# Altium schematic sheet 20_MicroSD_Connector.SchDoc
size A3; SheetNumber: 12; SheetTotal: 21
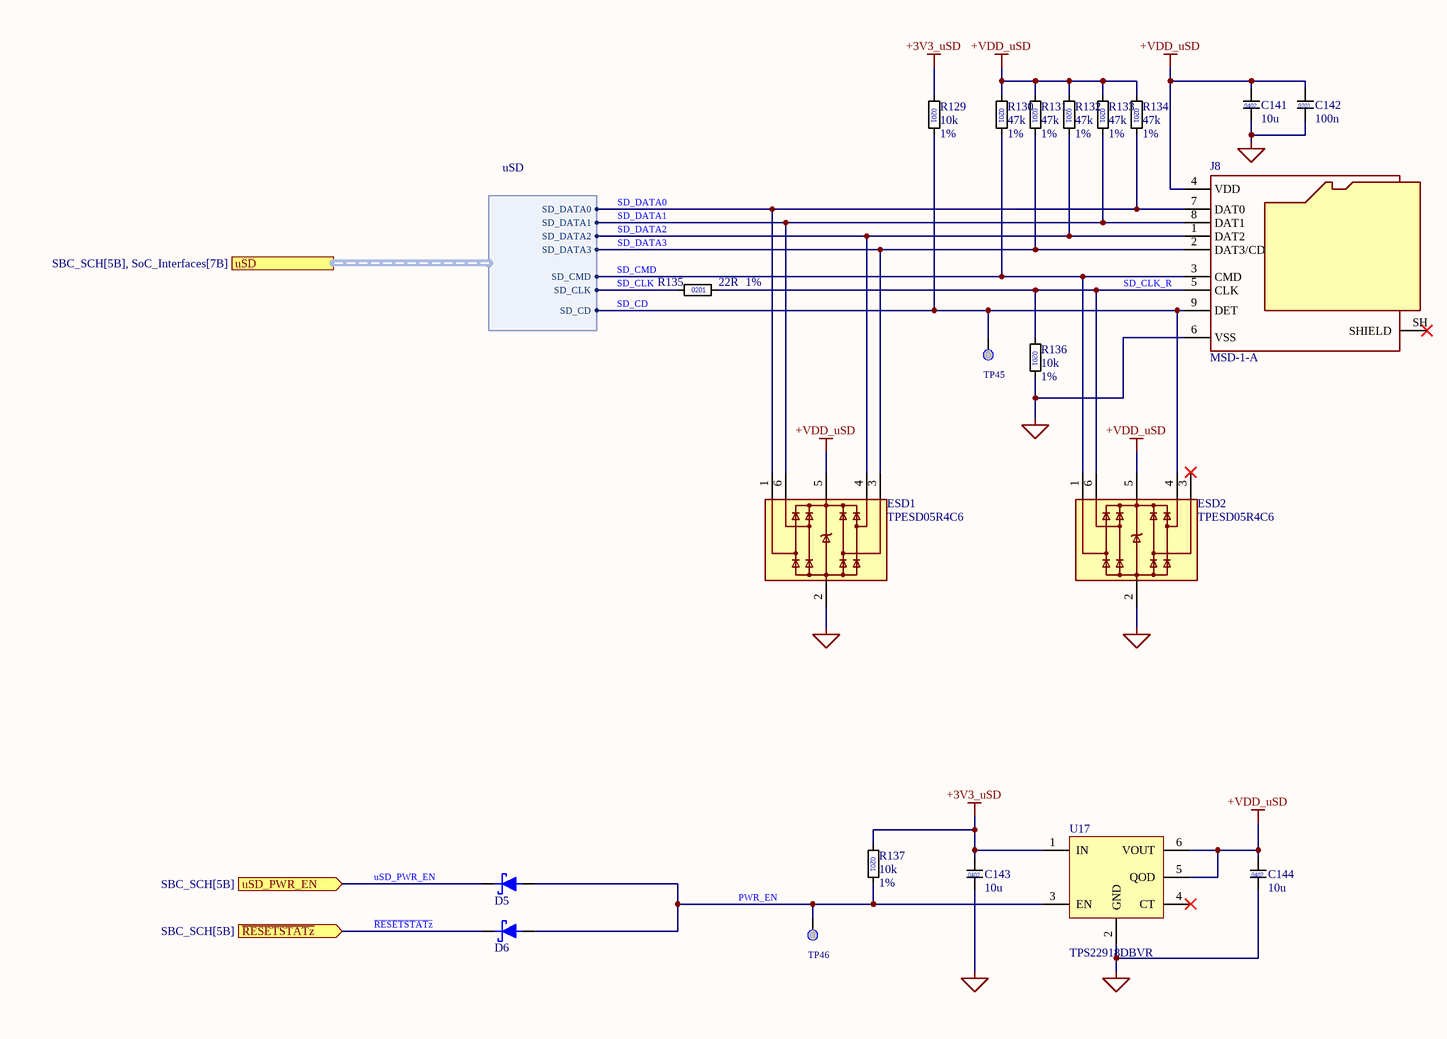
[diagram p0: 20_MicroSD_Connector.SchDoc]

## Parts
C141  value 10u  [C0402]  (hidden comment: 4u7)
C142  value 100n  [C0201]  (hidden comment: C_0201)
C143  value 10u  [C0402]  (hidden comment: 4u7)
C144  value 10u  [C0402]  (hidden comment: 4u7)
D5  D_Filled  [D_SOD-523]  (value not drawn)
D6  D_Filled  [D_SOD-523]  (value not drawn)
ESD1  TPESD05R4C6  [TPESD05R4C6]
ESD2  TPESD05R4C6  [TPESD05R4C6]
J8  MSD-1-A  [MSD-1-A]
R129  value 10k  Tolerance: 1%  [R0201]  (hidden comment: 0201)
R130  value 47k  Tolerance: 1%  [R0201]  (hidden comment: 0201)
R131  value 47k  Tolerance: 1%  [R0201]  (hidden comment: 0201)
R132  value 47k  Tolerance: 1%  [R0201]  (hidden comment: 0201)
R133  value 47k  Tolerance: 1%  [R0201]  (hidden comment: 0201)
R134  value 47k  Tolerance: 1%  [R0201]  (hidden comment: 0201)
R135  value 22R  Tolerance: 1%  [R0201]  (hidden comment: 0201)
R136  value 10k  Tolerance: 1%  [R0201]  (hidden comment: 0201)
R137  value 10k  Tolerance: 1%  [R0201]  (hidden comment: 0201)
TP45  Testpoint 0.5mm  [TP_0.50mm]  (value not drawn)  (no BOM)
TP46  Testpoint 0.5mm  [TP_0.50mm]  (value not drawn)  (no BOM)
U17  value TPS22918DBVR  [SOT-23-6]  (hidden comment: TPS22918)

## Ports
uSD (harness uSD, see SBC_SCH[5B], SoC_Interfaces[7B]), uSD_PWR_EN (in, see SBC_SCH[5B]), ~{RESETSTATz} (in, see SBC_SCH[5B])

## Harnesses
uSD: SD_DATA0, SD_DATA1, SD_DATA2, SD_DATA3, SD_CMD, SD_CLK, SD_CD

## Nets
+3V3_uSD: C143.1 R129.1 R137.1 U17.1(IN)
+VDD_uSD: C141.1 C142.1 C144.1 ESD1.5 ESD2.5 J8.4(VDD) R130.1 R131.1 R132.1 R133.1 R134.1 U17.5(QOD) U17.6(VOUT)
GND: C141.2 C142.2 C143.2 C144.2 ESD1.2 ESD2.2 J8.6(VSS) R136.2 U17.2(GND)
~{RESETSTATz}: D6.1(K) ; port ~{RESETSTATz}
PWR_EN: D5.2(A) D6.2(A) R137.2 TP46.TP U17.3(EN)
SD_CD: ESD2.4 J8.9(DET) R129.2 TP45.TP ; port uSD.SD_CD
SD_CLK: R135.1 ; port uSD.SD_CLK
SD_CLK_R: ESD2.6 J8.5(CLK) R135.2 R136.1
SD_CMD: ESD2.1 J8.3(CMD) R130.2 ; port uSD.SD_CMD
SD_DATA0: ESD1.1 J8.7(DAT0) R134.2 ; port uSD.SD_DATA0
SD_DATA1: ESD1.6 J8.8(DAT1) R133.2 ; port uSD.SD_DATA1
SD_DATA2: ESD1.4 J8.1(DAT2) R132.2 ; port uSD.SD_DATA2
SD_DATA3: ESD1.3 J8.2(DAT3/CD) R131.2 ; port uSD.SD_DATA3
uSD_PWR_EN: D5.1(K) ; port uSD_PWR_EN

Not connected (* = marked no-connect by the designer): ESD2 3*; J8 SH(SHIELD)*; U17 4(CT)*

## Notes on the sheet
- (in symbol C_0201) 0201
- (in symbol C_0402) 0402

## Library data of the parts
C141 C143 C144 = C_0402: MLCC 0402; Manufacturer_Name: *; Manufacturer_Part_Number: *
C142 = C_0201: MLCC 0201; Manufacturer_Name: *; Manufacturer_Part_Number: *
D5 D6 = D_Filled: Diode, filled shape; Manufacturer_Name: Panjit International Inc.; Value: BAT54TS_R1_00001; Manufacturer Part Number: BAT54TS_R1_00001
ESD1 ESD2 = TPESD05R4C6: ESD and Surge Protection (TVS/ESD) 1.3pF 5V 5uA 6.5A@8/20us 9V 9V Four channels SOT-363  ROHS; Manufacturer_Name: TECH PUBLIC; Manufacturer_Part_Number: TPESD05R4C6; Value: TPESD05R4C6
J8 = MSD-1-A: Micro SD Card Socket with one card detection pin; Manufacturer_Name: CUI; ComponentLink1Description: Datasheet; ComponentLink1URL: https://datasheet.lcsc.com/lcsc/2110151630_XKB-Connectivity-XKTF-015-N_C381082.pdf; Manufacturer_Part_Number: MSD-1-A; Value: MSD-1-A
R129-R137 = R_0201: Manufacturer_Name: *; Manufacturer_Part_Number: *
U17 = TPS22918: Load Switch -40℃~+105℃ 1 1V~5.5V 2A 53mΩ Active High SOT-23-6 Power Distribution Switches ROHS; Manufacturer_Name: Texas Instruments; Manufacturer_Part_Number: TPS22918DBVR